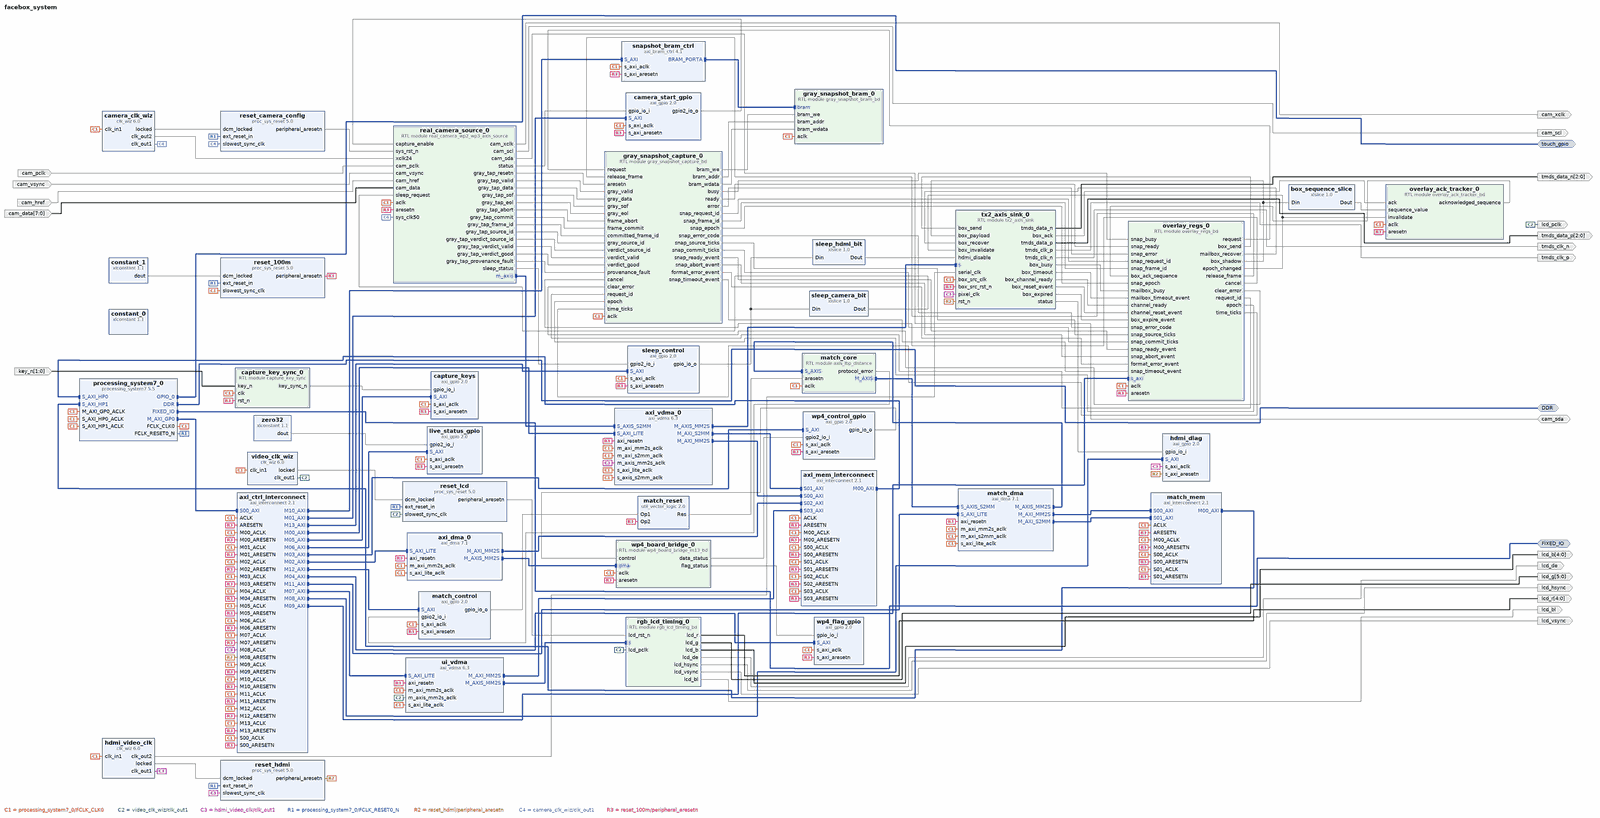
[diagram p0: block diagram of the top level, whole]
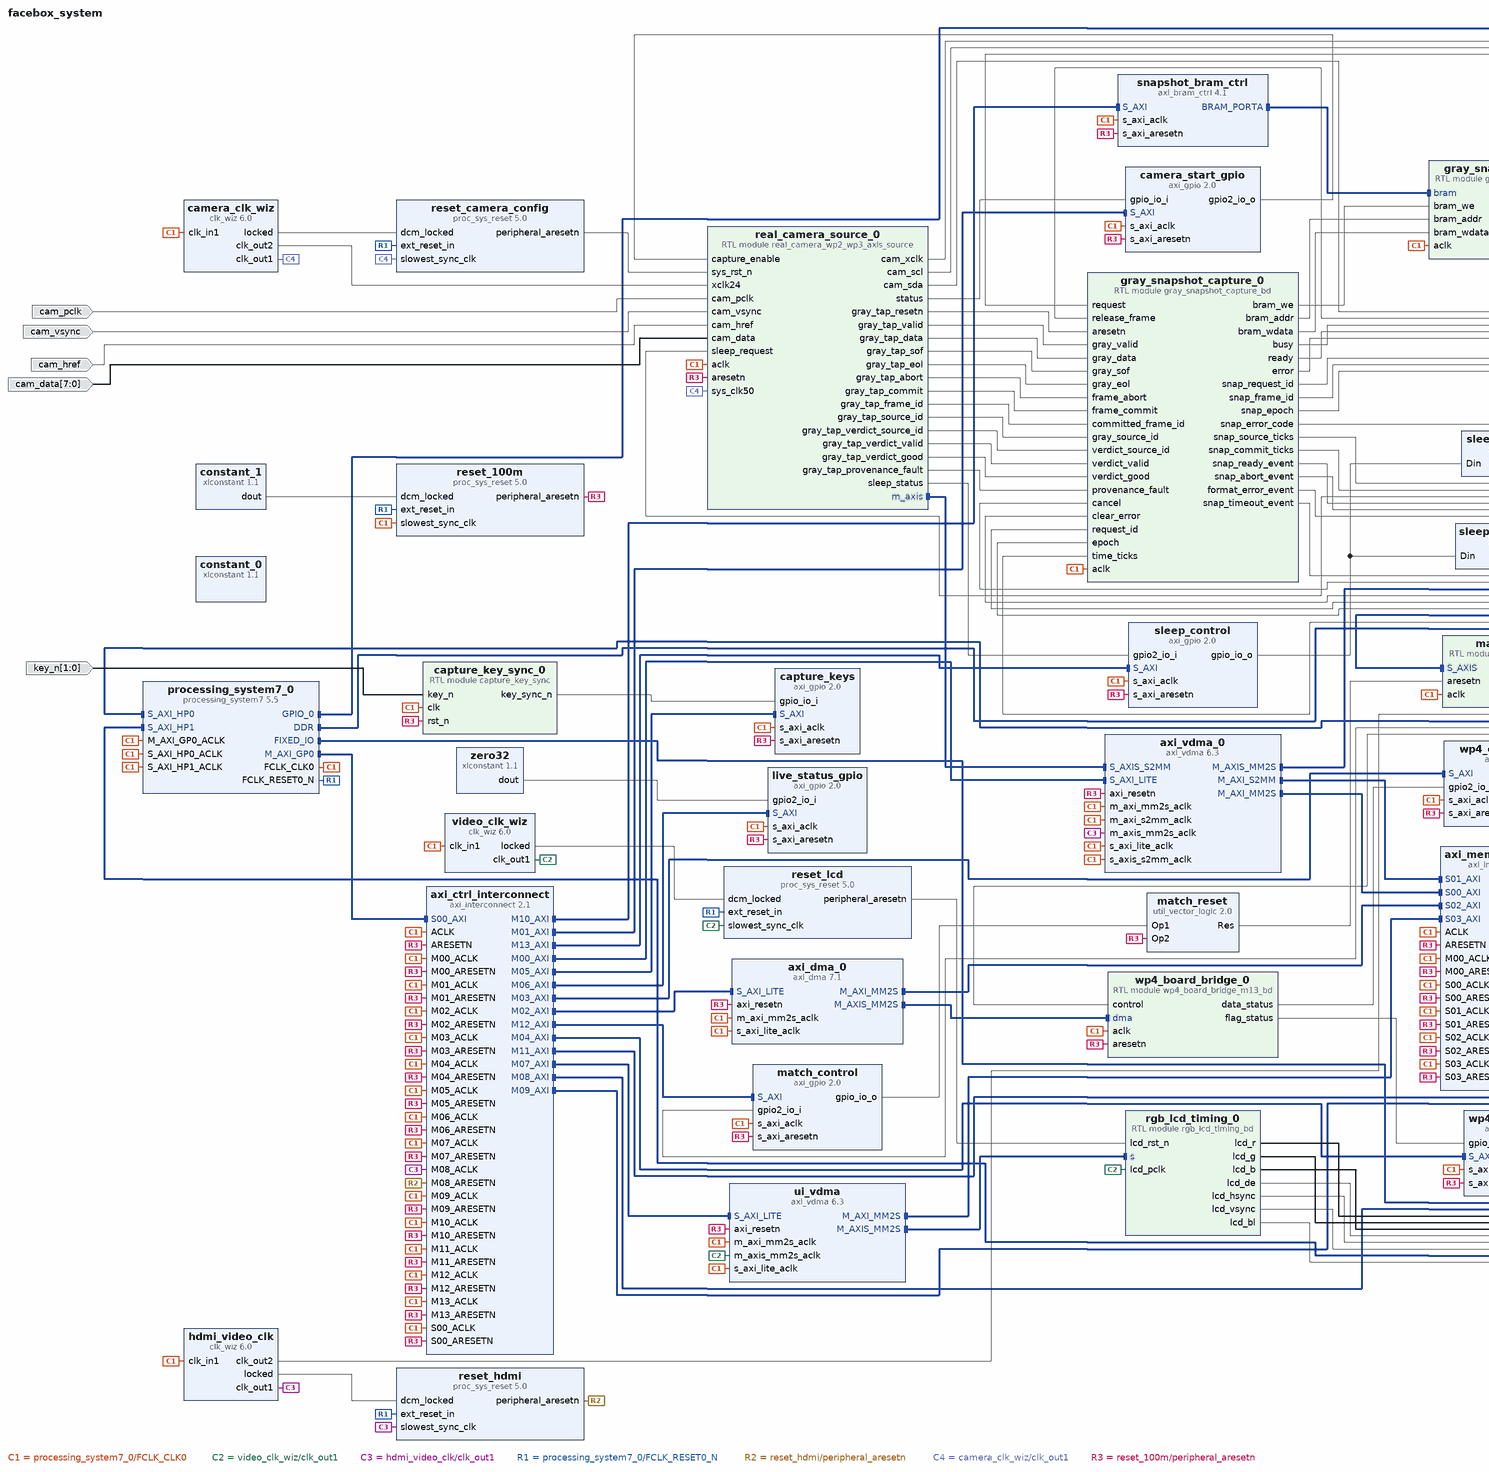
[diagram p1: block diagram of the top level, left part]
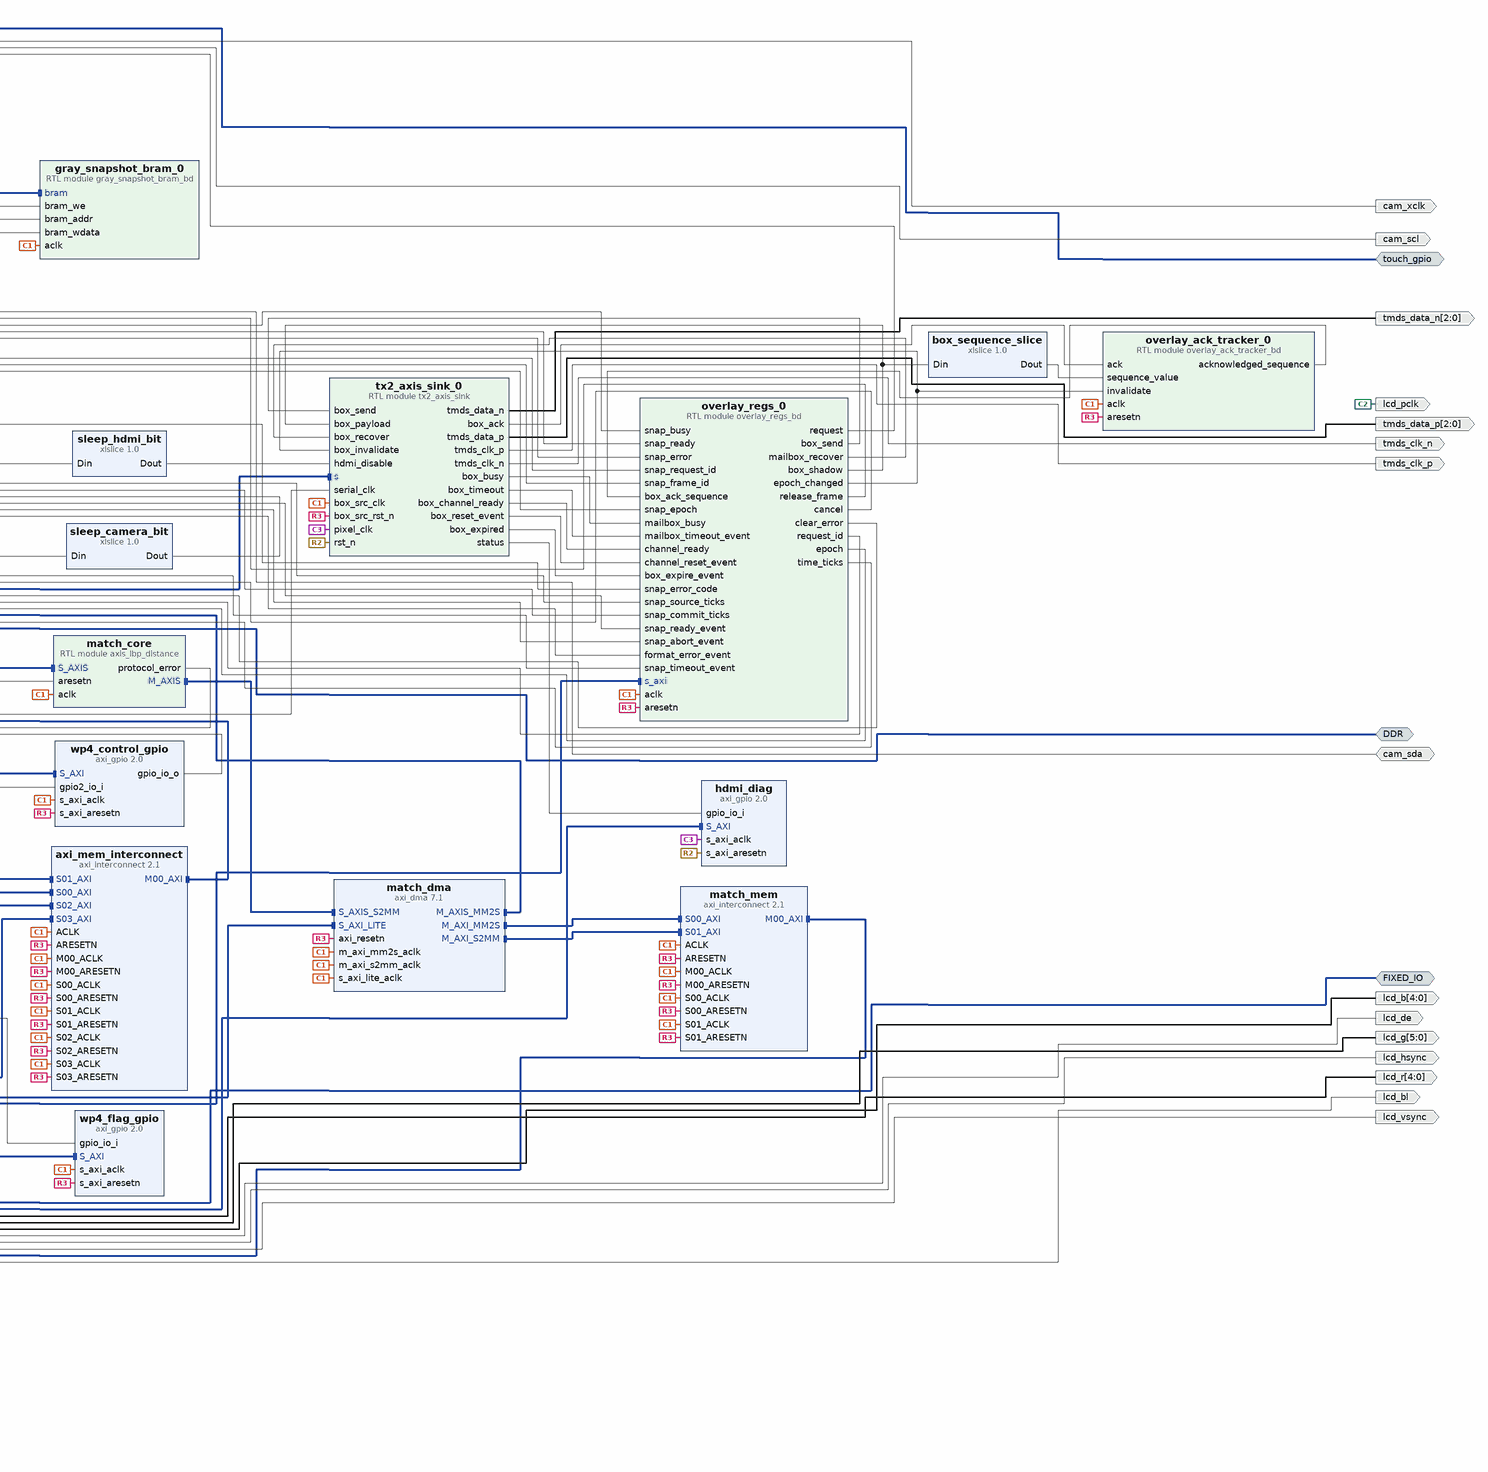
[diagram p2: block diagram of the top level, right part]
# Vivado block design facebox_system, xc7z020clg484-2, Vivado 2018.3
create_bd_design facebox_system

create_bd_intf_port -mode Master -vlnv xilinx.com:interface:gpio_rtl:1.0 touch_gpio
create_bd_intf_port -mode Master -vlnv xilinx.com:interface:ddrx_rtl:1.0 DDR
create_bd_intf_port -mode Master -vlnv xilinx.com:display_processing_system7:fixedio_rtl:1.0 FIXED_IO
create_bd_port -dir I -from 1 -to 0 key_n
create_bd_port -dir O -from 2 -to 0 tmds_data_p
create_bd_port -dir O -from 2 -to 0 tmds_data_n
create_bd_port -dir O -type clk tmds_clk_p
create_bd_port -dir O -type clk tmds_clk_n
create_bd_port -dir O -from 4 -to 0 lcd_r
create_bd_port -dir O -from 5 -to 0 lcd_g
create_bd_port -dir O -from 4 -to 0 lcd_b
create_bd_port -dir O lcd_de
create_bd_port -dir O lcd_hsync
create_bd_port -dir O lcd_vsync
create_bd_port -dir O lcd_bl
create_bd_port -dir O -type clk lcd_pclk
set_property -dict {CONFIG.FREQ_HZ 33333333} [get_bd_ports lcd_pclk]
create_bd_port -dir O cam_xclk
create_bd_port -dir O cam_scl
create_bd_port -dir IO cam_sda
create_bd_port -dir I -type clk cam_pclk
set_property -dict {CONFIG.FREQ_HZ 50000000} [get_bd_ports cam_pclk]
create_bd_port -dir I cam_vsync
create_bd_port -dir I cam_href
create_bd_port -dir I -from 7 -to 0 cam_data

create_bd_cell -type ip -vlnv xilinx.com:ip:processing_system7:5.5 processing_system7_0
set_property -dict [list \
  CONFIG.PCW_FPGA0_PERIPHERAL_FREQMHZ 100 \
  CONFIG.PCW_GPIO_EMIO_GPIO_ENABLE 1 \
  CONFIG.PCW_GPIO_EMIO_GPIO_IO 2 \
  CONFIG.PCW_GPIO_EMIO_GPIO_WIDTH 2 \
  CONFIG.PCW_GPIO_MIO_GPIO_ENABLE 1 \
  CONFIG.PCW_GPIO_MIO_GPIO_IO MIO \
  CONFIG.PCW_GPIO_PERIPHERAL_ENABLE 1 \
  CONFIG.PCW_I2C0_GRP_INT_ENABLE 0 \
  CONFIG.PCW_I2C0_I2C0_IO {MIO 50 .. 51} \
  CONFIG.PCW_I2C0_PERIPHERAL_ENABLE 1 \
  CONFIG.PCW_I2C_PERIPHERAL_FREQMHZ 111.111115 \
  CONFIG.PCW_I2C_RESET_ENABLE 1 \
  CONFIG.PCW_I2C_RESET_SELECT {Share reset pin} \
  CONFIG.PCW_PRESET_BANK1_VOLTAGE {LVCMOS 1.8V} \
  CONFIG.PCW_SD0_GRP_CD_ENABLE 0 \
  CONFIG.PCW_SD0_GRP_WP_ENABLE 0 \
  CONFIG.PCW_SD0_PERIPHERAL_ENABLE 1 \
  CONFIG.PCW_SD0_SD0_IO {MIO 40 .. 45} \
  CONFIG.PCW_SDIO_PERIPHERAL_FREQMHZ 50 \
  CONFIG.PCW_UIPARAM_DDR_PARTNO {MT41K256M16 RE-125} \
  CONFIG.PCW_USB_RESET_ENABLE 1 \
  CONFIG.PCW_USE_S_AXI_HP0 1 \
  CONFIG.PCW_USE_S_AXI_HP1 1 \
] [get_bd_cells processing_system7_0]
# 199 more settings of processing_system7_0 are not shown: defaults, MIO pin electricals, DDR timing, and values the tool derives
create_bd_cell -type ip -vlnv xilinx.com:ip:axi_vdma:6.3 axi_vdma_0
set_property -dict [list \
  CONFIG.c_enable_mm2s_delay_counter 0 \
  CONFIG.c_enable_mm2s_frm_counter 0 \
  CONFIG.c_enable_s2mm_delay_counter 0 \
  CONFIG.c_enable_s2mm_frm_counter 1 \
  CONFIG.c_include_mm2s 1 \
  CONFIG.c_include_mm2s_dre 0 \
  CONFIG.c_include_s2mm 1 \
  CONFIG.c_include_s2mm_dre 0 \
  CONFIG.c_include_sg 0 \
  CONFIG.c_m_axi_mm2s_data_width 64 \
  CONFIG.c_m_axi_s2mm_data_width 64 \
  CONFIG.c_m_axis_mm2s_tdata_width 16 \
  CONFIG.c_mm2s_linebuffer_depth 1024 \
  CONFIG.c_mm2s_max_burst_length 16 \
  CONFIG.c_num_fstores 3 \
  CONFIG.c_s2mm_linebuffer_depth 1024 \
  CONFIG.c_s2mm_max_burst_length 16 \
] [get_bd_cells axi_vdma_0]
create_bd_cell -type ip -vlnv xilinx.com:ip:axi_gpio:2.0 camera_start_gpio
set_property -dict [list \
  CONFIG.C_ALL_INPUTS 1 \
  CONFIG.C_ALL_OUTPUTS_2 1 \
  CONFIG.C_GPIO2_WIDTH 1 \
  CONFIG.C_GPIO_WIDTH 32 \
  CONFIG.C_IS_DUAL 1 \
] [get_bd_cells camera_start_gpio]
create_bd_cell -type ip -vlnv xilinx.com:ip:axi_interconnect:2.1 axi_ctrl_interconnect
set_property -dict {CONFIG.NUM_MI 14 CONFIG.NUM_SI 1} [get_bd_cells axi_ctrl_interconnect]
create_bd_cell -type ip -vlnv xilinx.com:ip:axi_gpio:2.0 capture_keys
set_property -dict {CONFIG.C_ALL_INPUTS 1 CONFIG.C_GPIO_WIDTH 2 CONFIG.C_IS_DUAL 0} [get_bd_cells capture_keys]
create_bd_cell -type module -reference capture_key_sync capture_key_sync_0
create_bd_cell -type ip -vlnv xilinx.com:ip:axi_gpio:2.0 live_status_gpio
set_property -dict [list \
  CONFIG.C_ALL_INPUTS_2 1 \
  CONFIG.C_ALL_OUTPUTS 1 \
  CONFIG.C_GPIO2_WIDTH 32 \
  CONFIG.C_GPIO_WIDTH 32 \
  CONFIG.C_IS_DUAL 1 \
] [get_bd_cells live_status_gpio]
create_bd_cell -type ip -vlnv xilinx.com:ip:axi_dma:7.1 axi_dma_0
set_property -dict [list \
  CONFIG.c_include_mm2s 1 \
  CONFIG.c_include_mm2s_dre 1 \
  CONFIG.c_include_s2mm 0 \
  CONFIG.c_include_sg 0 \
  CONFIG.c_m_axi_mm2s_data_width 64 \
  CONFIG.c_m_axis_mm2s_tdata_width 8 \
  CONFIG.c_mm2s_burst_size 16 \
  CONFIG.c_sg_length_width 23 \
] [get_bd_cells axi_dma_0]
create_bd_cell -type ip -vlnv xilinx.com:ip:axi_gpio:2.0 wp4_control_gpio
set_property -dict [list \
  CONFIG.C_ALL_INPUTS_2 1 \
  CONFIG.C_ALL_OUTPUTS 1 \
  CONFIG.C_GPIO2_WIDTH 32 \
  CONFIG.C_GPIO_WIDTH 30 \
  CONFIG.C_IS_DUAL 1 \
] [get_bd_cells wp4_control_gpio]
create_bd_cell -type ip -vlnv xilinx.com:ip:axi_gpio:2.0 wp4_flag_gpio
set_property -dict {CONFIG.C_ALL_INPUTS 1 CONFIG.C_GPIO_WIDTH 6 CONFIG.C_IS_DUAL 0} [get_bd_cells wp4_flag_gpio]
create_bd_cell -type module -reference wp4_board_bridge_m13_bd wp4_board_bridge_0
create_bd_cell -type ip -vlnv xilinx.com:ip:axi_interconnect:2.1 axi_mem_interconnect
set_property -dict {CONFIG.NUM_MI 1 CONFIG.NUM_SI 4} [get_bd_cells axi_mem_interconnect]
create_bd_cell -type ip -vlnv xilinx.com:ip:clk_wiz:6.0 video_clk_wiz
set_property -dict [list \
  CONFIG.CLKOUT1_DRIVES BUFG \
  CONFIG.CLKOUT1_REQUESTED_OUT_FREQ 33.333 \
  CONFIG.CLKOUT1_REQUESTED_PHASE 0.000 \
  CONFIG.CLKOUT2_DRIVES BUFG \
  CONFIG.CLKOUT2_REQUESTED_OUT_FREQ 33.333 \
  CONFIG.CLKOUT2_REQUESTED_PHASE 90.000 \
  CONFIG.CLKOUT2_USED true \
  CONFIG.NUM_OUT_CLKS 2 \
  CONFIG.PRIM_IN_FREQ 100.000 \
  CONFIG.USE_LOCKED true \
  CONFIG.USE_RESET false \
] [get_bd_cells video_clk_wiz]
create_bd_cell -type ip -vlnv xilinx.com:ip:proc_sys_reset:5.0 reset_100m
create_bd_cell -type ip -vlnv xilinx.com:ip:proc_sys_reset:5.0 reset_lcd
create_bd_cell -type ip -vlnv xilinx.com:ip:xlconstant:1.1 constant_1
set_property -dict {CONFIG.CONST_VAL 1} [get_bd_cells constant_1]
create_bd_cell -type ip -vlnv xilinx.com:ip:xlconstant:1.1 constant_0
set_property -dict {CONFIG.CONST_VAL 0} [get_bd_cells constant_0]
create_bd_cell -type module -reference real_camera_wp2_wp3_axis_source real_camera_source_0
create_bd_cell -type ip -vlnv xilinx.com:ip:clk_wiz:6.0 camera_clk_wiz
set_property -dict [list \
  CONFIG.CLKOUT1_DRIVES BUFG \
  CONFIG.CLKOUT1_REQUESTED_OUT_FREQ 50.000 \
  CONFIG.CLKOUT2_DRIVES BUFG \
  CONFIG.CLKOUT2_REQUESTED_OUT_FREQ 24.000 \
  CONFIG.CLKOUT2_USED true \
  CONFIG.NUM_OUT_CLKS 2 \
  CONFIG.PRIM_IN_FREQ 100.000 \
  CONFIG.USE_LOCKED true \
  CONFIG.USE_RESET false \
] [get_bd_cells camera_clk_wiz]
create_bd_cell -type ip -vlnv xilinx.com:ip:proc_sys_reset:5.0 reset_camera_config
create_bd_cell -type module -reference rgb_lcd_timing_bd rgb_lcd_timing_0
create_bd_cell -type ip -vlnv xilinx.com:ip:xlconstant:1.1 zero32
set_property -dict {CONFIG.CONST_VAL 0 CONFIG.CONST_WIDTH 32} [get_bd_cells zero32]
create_bd_cell -type ip -vlnv xilinx.com:ip:axi_vdma:6.3 ui_vdma
set_property -dict [list \
  CONFIG.c_include_mm2s 1 \
  CONFIG.c_include_mm2s_dre 0 \
  CONFIG.c_include_s2mm 0 \
  CONFIG.c_include_sg 0 \
  CONFIG.c_m_axi_mm2s_data_width 64 \
  CONFIG.c_m_axis_mm2s_tdata_width 16 \
  CONFIG.c_mm2s_linebuffer_depth 1024 \
  CONFIG.c_mm2s_max_burst_length 16 \
  CONFIG.c_num_fstores 2 \
] [get_bd_cells ui_vdma]
create_bd_cell -type ip -vlnv xilinx.com:ip:clk_wiz:6.0 hdmi_video_clk
set_property -dict [list \
  CONFIG.CLKOUT1_DRIVES BUFG \
  CONFIG.CLKOUT1_REQUESTED_OUT_FREQ 74.250 \
  CONFIG.CLKOUT2_DRIVES BUFG \
  CONFIG.CLKOUT2_REQUESTED_OUT_FREQ 371.250 \
  CONFIG.CLKOUT2_USED true \
  CONFIG.NUM_OUT_CLKS 2 \
  CONFIG.PRIM_IN_FREQ 100.000 \
  CONFIG.USE_LOCKED true \
  CONFIG.USE_RESET false \
] [get_bd_cells hdmi_video_clk]
create_bd_cell -type ip -vlnv xilinx.com:ip:proc_sys_reset:5.0 reset_hdmi
create_bd_cell -type module -reference tx2_axis_sink tx2_axis_sink_0
create_bd_cell -type ip -vlnv xilinx.com:ip:axi_gpio:2.0 hdmi_diag
set_property -dict {CONFIG.C_ALL_INPUTS 1 CONFIG.C_GPIO_WIDTH 32 CONFIG.C_IS_DUAL 0} [get_bd_cells hdmi_diag]
create_bd_cell -type module -reference overlay_regs_bd overlay_regs_0
create_bd_cell -type module -reference gray_snapshot_capture_bd gray_snapshot_capture_0
create_bd_cell -type module -reference gray_snapshot_bram_bd gray_snapshot_bram_0
create_bd_cell -type module -reference overlay_ack_tracker_bd overlay_ack_tracker_0
create_bd_cell -type ip -vlnv xilinx.com:ip:axi_bram_ctrl:4.1 snapshot_bram_ctrl
set_property -dict {CONFIG.DATA_WIDTH 32 CONFIG.SINGLE_PORT_BRAM 1} [get_bd_cells snapshot_bram_ctrl]
create_bd_cell -type ip -vlnv xilinx.com:ip:xlslice:1.0 box_sequence_slice
set_property -dict [list \
  CONFIG.DIN_FROM 447 \
  CONFIG.DIN_TO 416 \
  CONFIG.DIN_WIDTH 448 \
  CONFIG.DOUT_WIDTH 1 \
] [get_bd_cells box_sequence_slice]
create_bd_cell -type ip -vlnv xilinx.com:ip:axi_dma:7.1 match_dma
set_property -dict [list \
  CONFIG.c_include_mm2s 1 \
  CONFIG.c_include_mm2s_dre 0 \
  CONFIG.c_include_s2mm 1 \
  CONFIG.c_include_s2mm_dre 0 \
  CONFIG.c_include_sg 0 \
  CONFIG.c_m_axi_mm2s_data_width 64 \
  CONFIG.c_m_axi_s2mm_data_width 64 \
  CONFIG.c_m_axis_mm2s_tdata_width 32 \
  CONFIG.c_mm2s_burst_size 16 \
  CONFIG.c_s2mm_burst_size 16 \
  CONFIG.c_sg_length_width 23 \
] [get_bd_cells match_dma]
create_bd_cell -type ip -vlnv xilinx.com:ip:axi_gpio:2.0 match_control
set_property -dict [list \
  CONFIG.C_ALL_INPUTS_2 1 \
  CONFIG.C_ALL_OUTPUTS 1 \
  CONFIG.C_GPIO2_WIDTH 1 \
  CONFIG.C_GPIO_WIDTH 1 \
  CONFIG.C_IS_DUAL 1 \
] [get_bd_cells match_control]
create_bd_cell -type module -reference axis_lbp_distance match_core
create_bd_cell -type ip -vlnv xilinx.com:ip:axi_interconnect:2.1 match_mem
set_property -dict {CONFIG.NUM_MI 1 CONFIG.NUM_SI 2} [get_bd_cells match_mem]
create_bd_cell -type ip -vlnv xilinx.com:ip:util_vector_logic:2.0 match_reset
set_property -dict {CONFIG.C_OPERATION and CONFIG.C_SIZE 1} [get_bd_cells match_reset]
create_bd_cell -type ip -vlnv xilinx.com:ip:axi_gpio:2.0 sleep_control
set_property -dict [list \
  CONFIG.C_ALL_INPUTS_2 1 \
  CONFIG.C_ALL_OUTPUTS 1 \
  CONFIG.C_DOUT_DEFAULT 0x00000000 \
  CONFIG.C_GPIO2_WIDTH 32 \
  CONFIG.C_GPIO_WIDTH 2 \
  CONFIG.C_IS_DUAL 1 \
] [get_bd_cells sleep_control]
create_bd_cell -type ip -vlnv xilinx.com:ip:xlslice:1.0 sleep_camera_bit
set_property -dict {CONFIG.DIN_FROM 0 CONFIG.DIN_TO 0 CONFIG.DIN_WIDTH 2 CONFIG.DOUT_WIDTH 1} [get_bd_cells sleep_camera_bit]
create_bd_cell -type ip -vlnv xilinx.com:ip:xlslice:1.0 sleep_hdmi_bit
set_property -dict {CONFIG.DIN_FROM 1 CONFIG.DIN_TO 1 CONFIG.DIN_WIDTH 2 CONFIG.DOUT_WIDTH 1} [get_bd_cells sleep_hdmi_bit]

# ---- connections ----

connect_bd_intf_net [get_bd_intf_ports touch_gpio] [get_bd_intf_pins processing_system7_0/GPIO_0]
connect_bd_intf_net [get_bd_intf_pins axi_ctrl_interconnect/M05_AXI] [get_bd_intf_pins capture_keys/S_AXI]
connect_bd_intf_net [get_bd_intf_pins axi_ctrl_interconnect/M06_AXI] [get_bd_intf_pins live_status_gpio/S_AXI]
connect_bd_intf_net [get_bd_intf_pins axi_ctrl_interconnect/M03_AXI] [get_bd_intf_pins wp4_control_gpio/S_AXI]
connect_bd_intf_net [get_bd_intf_pins axi_ctrl_interconnect/M02_AXI] [get_bd_intf_pins axi_dma_0/S_AXI_LITE]
connect_bd_intf_net [get_bd_intf_pins axi_ctrl_interconnect/M04_AXI] [get_bd_intf_pins wp4_flag_gpio/S_AXI]
connect_bd_intf_net [get_bd_intf_pins axi_dma_0/M_AXIS_MM2S] [get_bd_intf_pins wp4_board_bridge_0/dma]
connect_bd_intf_net [get_bd_intf_pins axi_dma_0/M_AXI_MM2S] [get_bd_intf_pins axi_mem_interconnect/S02_AXI]
connect_bd_intf_net [get_bd_intf_ports DDR] [get_bd_intf_pins processing_system7_0/DDR]
connect_bd_intf_net [get_bd_intf_pins axi_ctrl_interconnect/M08_AXI] [get_bd_intf_pins hdmi_diag/S_AXI]
connect_bd_intf_net [get_bd_intf_pins real_camera_source_0/m_axis] [get_bd_intf_pins axi_vdma_0/S_AXIS_S2MM]
connect_bd_intf_net [get_bd_intf_pins axi_vdma_0/M_AXIS_MM2S] [get_bd_intf_pins tx2_axis_sink_0/s]
connect_bd_intf_net [get_bd_intf_ports FIXED_IO] [get_bd_intf_pins processing_system7_0/FIXED_IO]
connect_bd_intf_net [get_bd_intf_pins axi_ctrl_interconnect/M00_AXI] [get_bd_intf_pins axi_vdma_0/S_AXI_LITE]
connect_bd_intf_net [get_bd_intf_pins axi_ctrl_interconnect/M01_AXI] [get_bd_intf_pins camera_start_gpio/S_AXI]
connect_bd_intf_net [get_bd_intf_pins axi_vdma_0/M_AXI_S2MM] [get_bd_intf_pins axi_mem_interconnect/S01_AXI]
connect_bd_intf_net [get_bd_intf_pins axi_vdma_0/M_AXI_MM2S] [get_bd_intf_pins axi_mem_interconnect/S00_AXI]
connect_bd_intf_net [get_bd_intf_pins processing_system7_0/M_AXI_GP0] [get_bd_intf_pins axi_ctrl_interconnect/S00_AXI]
connect_bd_intf_net [get_bd_intf_pins axi_mem_interconnect/M00_AXI] [get_bd_intf_pins processing_system7_0/S_AXI_HP0]
connect_bd_intf_net [get_bd_intf_pins axi_ctrl_interconnect/M07_AXI] [get_bd_intf_pins ui_vdma/S_AXI_LITE]
connect_bd_intf_net [get_bd_intf_pins ui_vdma/M_AXIS_MM2S] [get_bd_intf_pins rgb_lcd_timing_0/s]
connect_bd_intf_net [get_bd_intf_pins ui_vdma/M_AXI_MM2S] [get_bd_intf_pins axi_mem_interconnect/S03_AXI]
connect_bd_intf_net [get_bd_intf_pins axi_ctrl_interconnect/M10_AXI] [get_bd_intf_pins snapshot_bram_ctrl/S_AXI]
connect_bd_intf_net [get_bd_intf_pins axi_ctrl_interconnect/M09_AXI] [get_bd_intf_pins overlay_regs_0/s_axi]
connect_bd_intf_net [get_bd_intf_pins snapshot_bram_ctrl/BRAM_PORTA] [get_bd_intf_pins gray_snapshot_bram_0/bram]
connect_bd_intf_net [get_bd_intf_pins match_dma/M_AXI_MM2S] [get_bd_intf_pins match_mem/S00_AXI]
connect_bd_intf_net [get_bd_intf_pins match_core/M_AXIS] [get_bd_intf_pins match_dma/S_AXIS_S2MM]
connect_bd_intf_net [get_bd_intf_pins axi_ctrl_interconnect/M12_AXI] [get_bd_intf_pins match_control/S_AXI]
connect_bd_intf_net [get_bd_intf_pins match_dma/M_AXI_S2MM] [get_bd_intf_pins match_mem/S01_AXI]
connect_bd_intf_net [get_bd_intf_pins match_mem/M00_AXI] [get_bd_intf_pins processing_system7_0/S_AXI_HP1]
connect_bd_intf_net [get_bd_intf_pins match_dma/M_AXIS_MM2S] [get_bd_intf_pins match_core/S_AXIS]
connect_bd_intf_net [get_bd_intf_pins axi_ctrl_interconnect/M11_AXI] [get_bd_intf_pins match_dma/S_AXI_LITE]
connect_bd_intf_net [get_bd_intf_pins axi_ctrl_interconnect/M13_AXI] [get_bd_intf_pins sleep_control/S_AXI]
connect_bd_net [get_bd_ports key_n] [get_bd_pins capture_key_sync_0/key_n]
connect_bd_net [get_bd_pins capture_key_sync_0/key_sync_n] [get_bd_pins capture_keys/gpio_io_i]
connect_bd_net [get_bd_pins wp4_control_gpio/gpio_io_o] [get_bd_pins wp4_board_bridge_0/control]
connect_bd_net [get_bd_pins wp4_board_bridge_0/data_status] [get_bd_pins wp4_control_gpio/gpio2_io_i]
connect_bd_net [get_bd_pins wp4_board_bridge_0/flag_status] [get_bd_pins wp4_flag_gpio/gpio_io_i]
connect_bd_net [get_bd_pins zero32/dout] [get_bd_pins live_status_gpio/gpio2_io_i]
connect_bd_net [get_bd_pins tx2_axis_sink_0/status] [get_bd_pins hdmi_diag/gpio_io_i]
connect_bd_net [get_bd_pins tx2_axis_sink_0/tmds_data_p] [get_bd_ports tmds_data_p]
connect_bd_net [get_bd_pins tx2_axis_sink_0/tmds_data_n] [get_bd_ports tmds_data_n]
connect_bd_net [get_bd_pins tx2_axis_sink_0/tmds_clk_p] [get_bd_ports tmds_clk_p]
connect_bd_net [get_bd_pins tx2_axis_sink_0/tmds_clk_n] [get_bd_ports tmds_clk_n]
connect_bd_net [get_bd_pins processing_system7_0/FCLK_CLK0] \
  [get_bd_pins processing_system7_0/M_AXI_GP0_ACLK] [get_bd_pins processing_system7_0/S_AXI_HP0_ACLK] \
  [get_bd_pins axi_ctrl_interconnect/ACLK] [get_bd_pins axi_ctrl_interconnect/S00_ACLK] \
  [get_bd_pins axi_ctrl_interconnect/M00_ACLK] [get_bd_pins axi_ctrl_interconnect/M01_ACLK] \
  [get_bd_pins axi_ctrl_interconnect/M02_ACLK] [get_bd_pins axi_ctrl_interconnect/M03_ACLK] \
  [get_bd_pins axi_ctrl_interconnect/M04_ACLK] [get_bd_pins axi_ctrl_interconnect/M05_ACLK] \
  [get_bd_pins axi_ctrl_interconnect/M06_ACLK] [get_bd_pins capture_keys/s_axi_aclk] [get_bd_pins capture_key_sync_0/clk] \
  [get_bd_pins live_status_gpio/s_axi_aclk] [get_bd_pins axi_ctrl_interconnect/M07_ACLK] \
  [get_bd_pins ui_vdma/s_axi_lite_aclk] [get_bd_pins ui_vdma/m_axi_mm2s_aclk] [get_bd_pins hdmi_video_clk/clk_in1] \
  [get_bd_pins axi_dma_0/s_axi_lite_aclk] [get_bd_pins axi_dma_0/m_axi_mm2s_aclk] [get_bd_pins wp4_control_gpio/s_axi_aclk] \
  [get_bd_pins wp4_flag_gpio/s_axi_aclk] [get_bd_pins wp4_board_bridge_0/aclk] [get_bd_pins axi_mem_interconnect/ACLK] \
  [get_bd_pins axi_mem_interconnect/S00_ACLK] [get_bd_pins axi_mem_interconnect/S01_ACLK] \
  [get_bd_pins axi_mem_interconnect/S02_ACLK] [get_bd_pins axi_mem_interconnect/S03_ACLK] \
  [get_bd_pins axi_mem_interconnect/M00_ACLK] [get_bd_pins axi_vdma_0/s_axi_lite_aclk] \
  [get_bd_pins axi_vdma_0/m_axi_mm2s_aclk] [get_bd_pins axi_vdma_0/m_axi_s2mm_aclk] \
  [get_bd_pins camera_start_gpio/s_axi_aclk] [get_bd_pins video_clk_wiz/clk_in1] [get_bd_pins reset_100m/slowest_sync_clk] \
  [get_bd_pins axi_vdma_0/s_axis_s2mm_aclk] [get_bd_pins real_camera_source_0/aclk] [get_bd_pins camera_clk_wiz/clk_in1] \
  [get_bd_pins axi_ctrl_interconnect/M09_ACLK] [get_bd_pins axi_ctrl_interconnect/M10_ACLK] [get_bd_pins overlay_regs_0/aclk] \
  [get_bd_pins gray_snapshot_capture_0/aclk] [get_bd_pins gray_snapshot_bram_0/aclk] [get_bd_pins overlay_ack_tracker_0/aclk] \
  [get_bd_pins snapshot_bram_ctrl/s_axi_aclk] [get_bd_pins tx2_axis_sink_0/box_src_clk] \
  [get_bd_pins axi_ctrl_interconnect/M11_ACLK] [get_bd_pins axi_ctrl_interconnect/M12_ACLK] \
  [get_bd_pins match_control/s_axi_aclk] [get_bd_pins match_dma/s_axi_lite_aclk] [get_bd_pins match_dma/m_axi_mm2s_aclk] \
  [get_bd_pins match_dma/m_axi_s2mm_aclk] [get_bd_pins match_core/aclk] [get_bd_pins match_mem/ACLK] \
  [get_bd_pins match_mem/S00_ACLK] [get_bd_pins match_mem/S01_ACLK] [get_bd_pins match_mem/M00_ACLK] \
  [get_bd_pins processing_system7_0/S_AXI_HP1_ACLK] [get_bd_pins axi_ctrl_interconnect/M13_ACLK] \
  [get_bd_pins sleep_control/s_axi_aclk]
connect_bd_net [get_bd_pins video_clk_wiz/clk_out1] \
  [get_bd_pins ui_vdma/m_axis_mm2s_aclk] [get_bd_pins rgb_lcd_timing_0/lcd_pclk] [get_bd_pins reset_lcd/slowest_sync_clk] \
  [get_bd_ports lcd_pclk]
connect_bd_net [get_bd_pins hdmi_video_clk/clk_out1] \
  [get_bd_pins axi_vdma_0/m_axis_mm2s_aclk] [get_bd_pins tx2_axis_sink_0/pixel_clk] [get_bd_pins reset_hdmi/slowest_sync_clk] \
  [get_bd_pins hdmi_diag/s_axi_aclk] [get_bd_pins axi_ctrl_interconnect/M08_ACLK]
connect_bd_net [get_bd_pins hdmi_video_clk/clk_out2] [get_bd_pins tx2_axis_sink_0/serial_clk]
connect_bd_net [get_bd_pins hdmi_video_clk/locked] [get_bd_pins reset_hdmi/dcm_locked]
connect_bd_net [get_bd_pins processing_system7_0/FCLK_RESET0_N] \
  [get_bd_pins reset_hdmi/ext_reset_in] [get_bd_pins reset_100m/ext_reset_in] [get_bd_pins reset_lcd/ext_reset_in] \
  [get_bd_pins reset_camera_config/ext_reset_in]
connect_bd_net [get_bd_pins reset_hdmi/peripheral_aresetn] \
  [get_bd_pins tx2_axis_sink_0/rst_n] [get_bd_pins hdmi_diag/s_axi_aresetn] [get_bd_pins axi_ctrl_interconnect/M08_ARESETN]
connect_bd_net [get_bd_pins camera_clk_wiz/clk_out1] [get_bd_pins reset_camera_config/slowest_sync_clk] [get_bd_pins real_camera_source_0/sys_clk50]
connect_bd_net [get_bd_pins camera_clk_wiz/clk_out2] [get_bd_pins real_camera_source_0/xclk24]
connect_bd_net [get_bd_pins constant_1/dout] [get_bd_pins reset_100m/dcm_locked]
connect_bd_net [get_bd_pins video_clk_wiz/locked] [get_bd_pins reset_lcd/dcm_locked]
connect_bd_net [get_bd_pins camera_clk_wiz/locked] [get_bd_pins reset_camera_config/dcm_locked]
connect_bd_net [get_bd_pins reset_100m/peripheral_aresetn] \
  [get_bd_pins axi_ctrl_interconnect/ARESETN] [get_bd_pins axi_ctrl_interconnect/S00_ARESETN] \
  [get_bd_pins axi_ctrl_interconnect/M00_ARESETN] [get_bd_pins axi_ctrl_interconnect/M01_ARESETN] \
  [get_bd_pins axi_ctrl_interconnect/M02_ARESETN] [get_bd_pins axi_ctrl_interconnect/M03_ARESETN] \
  [get_bd_pins axi_ctrl_interconnect/M04_ARESETN] [get_bd_pins axi_ctrl_interconnect/M05_ARESETN] \
  [get_bd_pins axi_ctrl_interconnect/M06_ARESETN] [get_bd_pins capture_keys/s_axi_aresetn] \
  [get_bd_pins capture_key_sync_0/rst_n] [get_bd_pins live_status_gpio/s_axi_aresetn] \
  [get_bd_pins axi_ctrl_interconnect/M07_ARESETN] [get_bd_pins ui_vdma/axi_resetn] [get_bd_pins axi_dma_0/axi_resetn] \
  [get_bd_pins wp4_control_gpio/s_axi_aresetn] [get_bd_pins wp4_flag_gpio/s_axi_aresetn] \
  [get_bd_pins wp4_board_bridge_0/aresetn] [get_bd_pins axi_mem_interconnect/ARESETN] \
  [get_bd_pins axi_mem_interconnect/S00_ARESETN] [get_bd_pins axi_mem_interconnect/S01_ARESETN] \
  [get_bd_pins axi_mem_interconnect/S02_ARESETN] [get_bd_pins axi_mem_interconnect/S03_ARESETN] \
  [get_bd_pins axi_mem_interconnect/M00_ARESETN] [get_bd_pins axi_vdma_0/axi_resetn] \
  [get_bd_pins camera_start_gpio/s_axi_aresetn] [get_bd_pins real_camera_source_0/aresetn] \
  [get_bd_pins axi_ctrl_interconnect/M09_ARESETN] [get_bd_pins axi_ctrl_interconnect/M10_ARESETN] \
  [get_bd_pins overlay_regs_0/aresetn] [get_bd_pins overlay_ack_tracker_0/aresetn] \
  [get_bd_pins snapshot_bram_ctrl/s_axi_aresetn] [get_bd_pins tx2_axis_sink_0/box_src_rst_n] [get_bd_pins match_reset/Op2] \
  [get_bd_pins axi_ctrl_interconnect/M11_ARESETN] [get_bd_pins axi_ctrl_interconnect/M12_ARESETN] \
  [get_bd_pins match_control/s_axi_aresetn] [get_bd_pins match_dma/axi_resetn] [get_bd_pins match_mem/ARESETN] \
  [get_bd_pins match_mem/S00_ARESETN] [get_bd_pins match_mem/S01_ARESETN] [get_bd_pins match_mem/M00_ARESETN] \
  [get_bd_pins axi_ctrl_interconnect/M13_ARESETN] [get_bd_pins sleep_control/s_axi_aresetn]
connect_bd_net [get_bd_pins reset_lcd/peripheral_aresetn] [get_bd_pins rgb_lcd_timing_0/lcd_rst_n]
connect_bd_net [get_bd_pins reset_camera_config/peripheral_aresetn] [get_bd_pins real_camera_source_0/sys_rst_n]
connect_bd_net [get_bd_pins real_camera_source_0/status] [get_bd_pins camera_start_gpio/gpio_io_i]
connect_bd_net [get_bd_pins camera_start_gpio/gpio2_io_o] [get_bd_pins real_camera_source_0/capture_enable]
connect_bd_net [get_bd_pins rgb_lcd_timing_0/lcd_r] [get_bd_ports lcd_r]
connect_bd_net [get_bd_pins rgb_lcd_timing_0/lcd_g] [get_bd_ports lcd_g]
connect_bd_net [get_bd_pins rgb_lcd_timing_0/lcd_b] [get_bd_ports lcd_b]
connect_bd_net [get_bd_pins rgb_lcd_timing_0/lcd_de] [get_bd_ports lcd_de]
connect_bd_net [get_bd_pins rgb_lcd_timing_0/lcd_hsync] [get_bd_ports lcd_hsync]
connect_bd_net [get_bd_pins rgb_lcd_timing_0/lcd_vsync] [get_bd_ports lcd_vsync]
connect_bd_net [get_bd_pins rgb_lcd_timing_0/lcd_bl] [get_bd_ports lcd_bl]
connect_bd_net [get_bd_pins real_camera_source_0/cam_xclk] [get_bd_ports cam_xclk]
connect_bd_net [get_bd_pins real_camera_source_0/cam_scl] [get_bd_ports cam_scl]
connect_bd_net [get_bd_ports cam_sda] [get_bd_pins real_camera_source_0/cam_sda]
connect_bd_net -net cam_pclk_0_1 [get_bd_ports cam_pclk] [get_bd_pins real_camera_source_0/cam_pclk]
connect_bd_net -net cam_vsync_0_1 [get_bd_ports cam_vsync] [get_bd_pins real_camera_source_0/cam_vsync]
connect_bd_net -net cam_href_0_1 [get_bd_ports cam_href] [get_bd_pins real_camera_source_0/cam_href]
connect_bd_net -net cam_data_0_1 [get_bd_ports cam_data] [get_bd_pins real_camera_source_0/cam_data]
connect_bd_net [get_bd_pins real_camera_source_0/gray_tap_resetn] [get_bd_pins gray_snapshot_capture_0/aresetn]
connect_bd_net [get_bd_pins real_camera_source_0/gray_tap_valid] [get_bd_pins gray_snapshot_capture_0/gray_valid]
connect_bd_net [get_bd_pins real_camera_source_0/gray_tap_data] [get_bd_pins gray_snapshot_capture_0/gray_data]
connect_bd_net [get_bd_pins real_camera_source_0/gray_tap_sof] [get_bd_pins gray_snapshot_capture_0/gray_sof]
connect_bd_net [get_bd_pins real_camera_source_0/gray_tap_eol] [get_bd_pins gray_snapshot_capture_0/gray_eol]
connect_bd_net [get_bd_pins real_camera_source_0/gray_tap_abort] [get_bd_pins gray_snapshot_capture_0/frame_abort]
connect_bd_net [get_bd_pins real_camera_source_0/gray_tap_commit] [get_bd_pins gray_snapshot_capture_0/frame_commit]
connect_bd_net [get_bd_pins real_camera_source_0/gray_tap_frame_id] [get_bd_pins gray_snapshot_capture_0/committed_frame_id]
connect_bd_net [get_bd_pins real_camera_source_0/gray_tap_source_id] [get_bd_pins gray_snapshot_capture_0/gray_source_id]
connect_bd_net [get_bd_pins real_camera_source_0/gray_tap_verdict_source_id] [get_bd_pins gray_snapshot_capture_0/verdict_source_id]
connect_bd_net [get_bd_pins real_camera_source_0/gray_tap_verdict_valid] [get_bd_pins gray_snapshot_capture_0/verdict_valid]
connect_bd_net [get_bd_pins real_camera_source_0/gray_tap_verdict_good] [get_bd_pins gray_snapshot_capture_0/verdict_good]
connect_bd_net [get_bd_pins real_camera_source_0/gray_tap_provenance_fault] [get_bd_pins gray_snapshot_capture_0/provenance_fault]
connect_bd_net [get_bd_pins overlay_regs_0/request] [get_bd_pins gray_snapshot_capture_0/request]
connect_bd_net [get_bd_pins overlay_regs_0/release_frame] [get_bd_pins gray_snapshot_capture_0/release_frame]
connect_bd_net [get_bd_pins overlay_regs_0/cancel] [get_bd_pins gray_snapshot_capture_0/cancel]
connect_bd_net [get_bd_pins overlay_regs_0/clear_error] [get_bd_pins gray_snapshot_capture_0/clear_error]
connect_bd_net [get_bd_pins overlay_regs_0/request_id] [get_bd_pins gray_snapshot_capture_0/request_id]
connect_bd_net [get_bd_pins overlay_regs_0/epoch] [get_bd_pins gray_snapshot_capture_0/epoch]
connect_bd_net [get_bd_pins overlay_regs_0/time_ticks] [get_bd_pins gray_snapshot_capture_0/time_ticks]
connect_bd_net [get_bd_pins gray_snapshot_capture_0/busy] [get_bd_pins overlay_regs_0/snap_busy]
connect_bd_net [get_bd_pins gray_snapshot_capture_0/ready] [get_bd_pins overlay_regs_0/snap_ready]
connect_bd_net [get_bd_pins gray_snapshot_capture_0/error] [get_bd_pins overlay_regs_0/snap_error]
connect_bd_net [get_bd_pins gray_snapshot_capture_0/snap_request_id] [get_bd_pins overlay_regs_0/snap_request_id]
connect_bd_net [get_bd_pins gray_snapshot_capture_0/snap_frame_id] [get_bd_pins overlay_regs_0/snap_frame_id]
connect_bd_net [get_bd_pins gray_snapshot_capture_0/snap_epoch] [get_bd_pins overlay_regs_0/snap_epoch]
connect_bd_net [get_bd_pins gray_snapshot_capture_0/snap_error_code] [get_bd_pins overlay_regs_0/snap_error_code]
connect_bd_net [get_bd_pins gray_snapshot_capture_0/snap_source_ticks] [get_bd_pins overlay_regs_0/snap_source_ticks]
connect_bd_net [get_bd_pins gray_snapshot_capture_0/snap_commit_ticks] [get_bd_pins overlay_regs_0/snap_commit_ticks]
connect_bd_net [get_bd_pins gray_snapshot_capture_0/snap_ready_event] [get_bd_pins overlay_regs_0/snap_ready_event]
connect_bd_net [get_bd_pins gray_snapshot_capture_0/snap_abort_event] [get_bd_pins overlay_regs_0/snap_abort_event]
connect_bd_net [get_bd_pins gray_snapshot_capture_0/format_error_event] [get_bd_pins overlay_regs_0/format_error_event]
connect_bd_net [get_bd_pins gray_snapshot_capture_0/snap_timeout_event] [get_bd_pins overlay_regs_0/snap_timeout_event]
connect_bd_net [get_bd_pins gray_snapshot_capture_0/bram_we] [get_bd_pins gray_snapshot_bram_0/bram_we]
connect_bd_net [get_bd_pins gray_snapshot_capture_0/bram_addr] [get_bd_pins gray_snapshot_bram_0/bram_addr]
connect_bd_net [get_bd_pins gray_snapshot_capture_0/bram_wdata] [get_bd_pins gray_snapshot_bram_0/bram_wdata]
connect_bd_net [get_bd_pins overlay_regs_0/box_send] [get_bd_pins tx2_axis_sink_0/box_send]
connect_bd_net [get_bd_pins overlay_regs_0/mailbox_recover] [get_bd_pins tx2_axis_sink_0/box_recover]
connect_bd_net [get_bd_pins overlay_regs_0/epoch_changed] [get_bd_pins tx2_axis_sink_0/box_invalidate] [get_bd_pins overlay_ack_tracker_0/invalidate]
connect_bd_net [get_bd_pins overlay_regs_0/box_shadow] [get_bd_pins tx2_axis_sink_0/box_payload] [get_bd_pins box_sequence_slice/Din]
connect_bd_net [get_bd_pins tx2_axis_sink_0/box_busy] [get_bd_pins overlay_regs_0/mailbox_busy]
connect_bd_net [get_bd_pins tx2_axis_sink_0/box_timeout] [get_bd_pins overlay_regs_0/mailbox_timeout_event]
connect_bd_net [get_bd_pins tx2_axis_sink_0/box_channel_ready] [get_bd_pins overlay_regs_0/channel_ready]
connect_bd_net [get_bd_pins tx2_axis_sink_0/box_reset_event] [get_bd_pins overlay_regs_0/channel_reset_event]
connect_bd_net [get_bd_pins tx2_axis_sink_0/box_expired] [get_bd_pins overlay_regs_0/box_expire_event]
connect_bd_net [get_bd_pins tx2_axis_sink_0/box_ack] [get_bd_pins overlay_ack_tracker_0/ack]
connect_bd_net [get_bd_pins box_sequence_slice/Dout] [get_bd_pins overlay_ack_tracker_0/sequence_value]
connect_bd_net [get_bd_pins overlay_ack_tracker_0/acknowledged_sequence] [get_bd_pins overlay_regs_0/box_ack_sequence]
connect_bd_net [get_bd_pins match_control/gpio_io_o] [get_bd_pins match_reset/Op1]
connect_bd_net [get_bd_pins match_reset/Res] [get_bd_pins match_core/aresetn]
connect_bd_net [get_bd_pins match_core/protocol_error] [get_bd_pins match_control/gpio2_io_i]
connect_bd_net [get_bd_pins sleep_control/gpio_io_o] [get_bd_pins sleep_camera_bit/Din] [get_bd_pins sleep_hdmi_bit/Din]
connect_bd_net [get_bd_pins sleep_camera_bit/Dout] [get_bd_pins real_camera_source_0/sleep_request]
connect_bd_net [get_bd_pins sleep_hdmi_bit/Dout] [get_bd_pins tx2_axis_sink_0/hdmi_disable]
connect_bd_net [get_bd_pins real_camera_source_0/sleep_status] [get_bd_pins sleep_control/gpio2_io_i]

# ---- address map ----
assign_bd_address -offset 0x00000000 -range 1G -target_address_space [get_bd_addr_spaces axi_dma_0/Data_MM2S] [get_bd_addr_segs processing_system7_0/S_AXI_HP0/HP0_DDR_LOWOCM]
assign_bd_address -offset 0x00000000 -range 1G -target_address_space [get_bd_addr_spaces axi_vdma_0/Data_MM2S] [get_bd_addr_segs processing_system7_0/S_AXI_HP0/HP0_DDR_LOWOCM]
assign_bd_address -offset 0x00000000 -range 1G -target_address_space [get_bd_addr_spaces axi_vdma_0/Data_S2MM] [get_bd_addr_segs processing_system7_0/S_AXI_HP0/HP0_DDR_LOWOCM]
assign_bd_address -offset 0x00000000 -range 1G -target_address_space [get_bd_addr_spaces match_dma/Data_MM2S] [get_bd_addr_segs processing_system7_0/S_AXI_HP1/HP1_DDR_LOWOCM]
assign_bd_address -offset 0x00000000 -range 1G -target_address_space [get_bd_addr_spaces match_dma/Data_S2MM] [get_bd_addr_segs processing_system7_0/S_AXI_HP1/HP1_DDR_LOWOCM]
assign_bd_address -offset 0x40400000 -range 64K -target_address_space [get_bd_addr_spaces processing_system7_0/Data] [get_bd_addr_segs axi_dma_0/S_AXI_LITE/Reg]
assign_bd_address -offset 0x40410000 -range 64K -target_address_space [get_bd_addr_spaces processing_system7_0/Data] [get_bd_addr_segs match_dma/S_AXI_LITE/Reg]
assign_bd_address -offset 0x41200000 -range 64K -target_address_space [get_bd_addr_spaces processing_system7_0/Data] [get_bd_addr_segs camera_start_gpio/S_AXI/Reg]
assign_bd_address -offset 0x41210000 -range 64K -target_address_space [get_bd_addr_spaces processing_system7_0/Data] [get_bd_addr_segs hdmi_diag/S_AXI/Reg]
assign_bd_address -offset 0x41220000 -range 64K -target_address_space [get_bd_addr_spaces processing_system7_0/Data] [get_bd_addr_segs wp4_control_gpio/S_AXI/Reg]
assign_bd_address -offset 0x41230000 -range 64K -target_address_space [get_bd_addr_spaces processing_system7_0/Data] [get_bd_addr_segs wp4_flag_gpio/S_AXI/Reg]
assign_bd_address -offset 0x41240000 -range 64K -target_address_space [get_bd_addr_spaces processing_system7_0/Data] [get_bd_addr_segs capture_keys/S_AXI/Reg]
assign_bd_address -offset 0x41250000 -range 64K -target_address_space [get_bd_addr_spaces processing_system7_0/Data] [get_bd_addr_segs live_status_gpio/S_AXI/Reg]
assign_bd_address -offset 0x41260000 -range 64K -target_address_space [get_bd_addr_spaces processing_system7_0/Data] [get_bd_addr_segs overlay_regs_0/s_axi/reg0]
assign_bd_address -offset 0x41280000 -range 64K -target_address_space [get_bd_addr_spaces processing_system7_0/Data] [get_bd_addr_segs match_control/S_AXI/Reg]
assign_bd_address -offset 0x41290000 -range 64K -target_address_space [get_bd_addr_spaces processing_system7_0/Data] [get_bd_addr_segs sleep_control/S_AXI/Reg]
assign_bd_address -offset 0x42000000 -range 128K -target_address_space [get_bd_addr_spaces processing_system7_0/Data] [get_bd_addr_segs snapshot_bram_ctrl/S_AXI/Mem0]
assign_bd_address -offset 0x43000000 -range 64K -target_address_space [get_bd_addr_spaces processing_system7_0/Data] [get_bd_addr_segs axi_vdma_0/S_AXI_LITE/Reg]
assign_bd_address -offset 0x43010000 -range 64K -target_address_space [get_bd_addr_spaces processing_system7_0/Data] [get_bd_addr_segs ui_vdma/S_AXI_LITE/Reg]
assign_bd_address -offset 0x00000000 -range 1G -target_address_space [get_bd_addr_spaces ui_vdma/Data_MM2S] [get_bd_addr_segs processing_system7_0/S_AXI_HP0/HP0_DDR_LOWOCM]

validate_bd_design
save_bd_design
